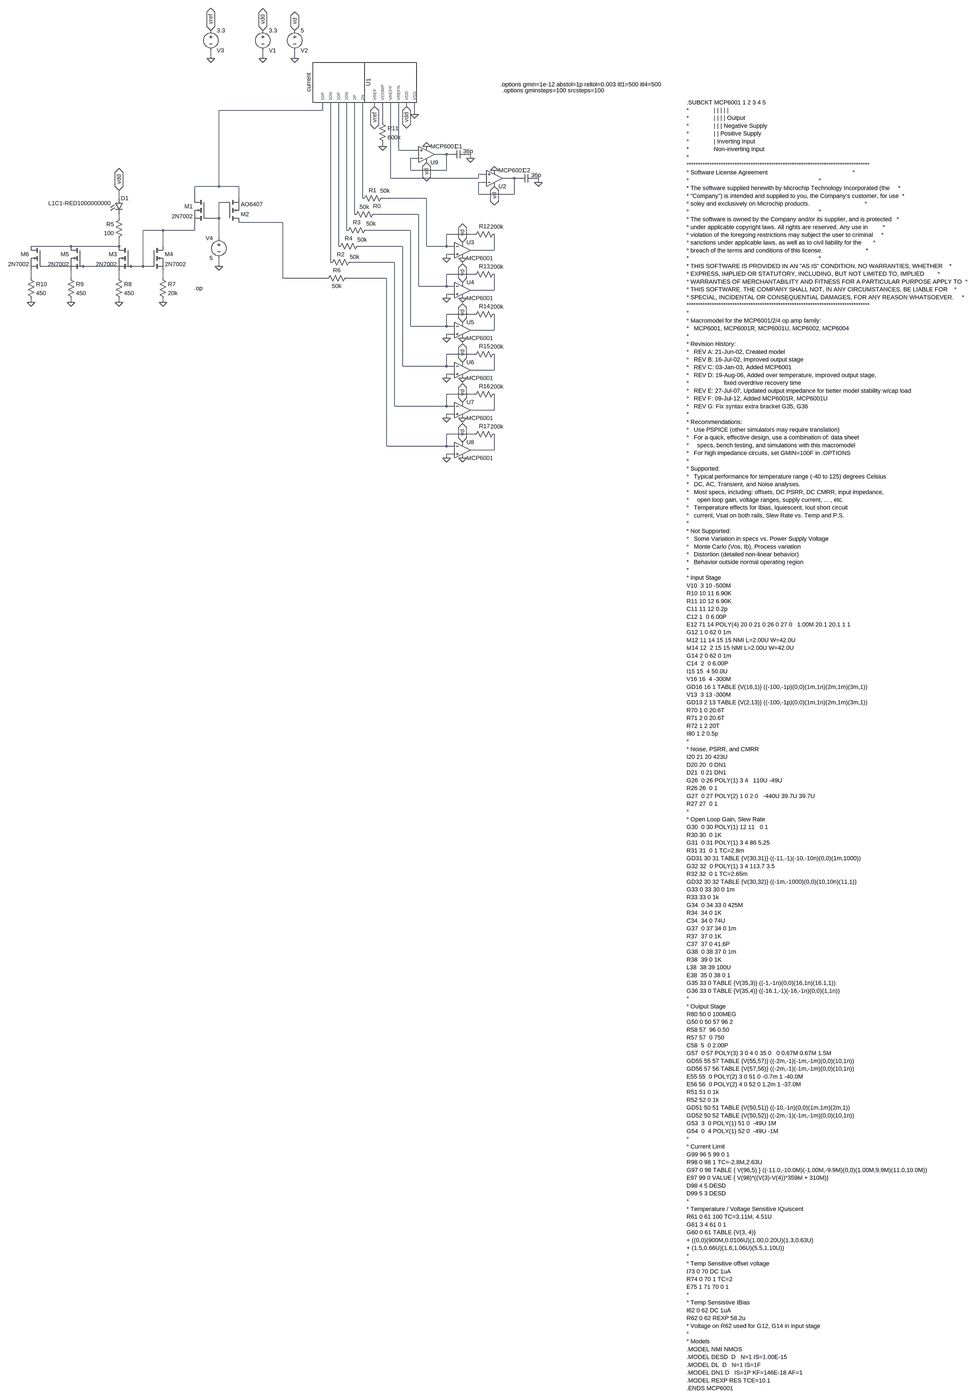
[diagram p0: schematic Chipa_schem_mcp6001.asc, whole sheet]
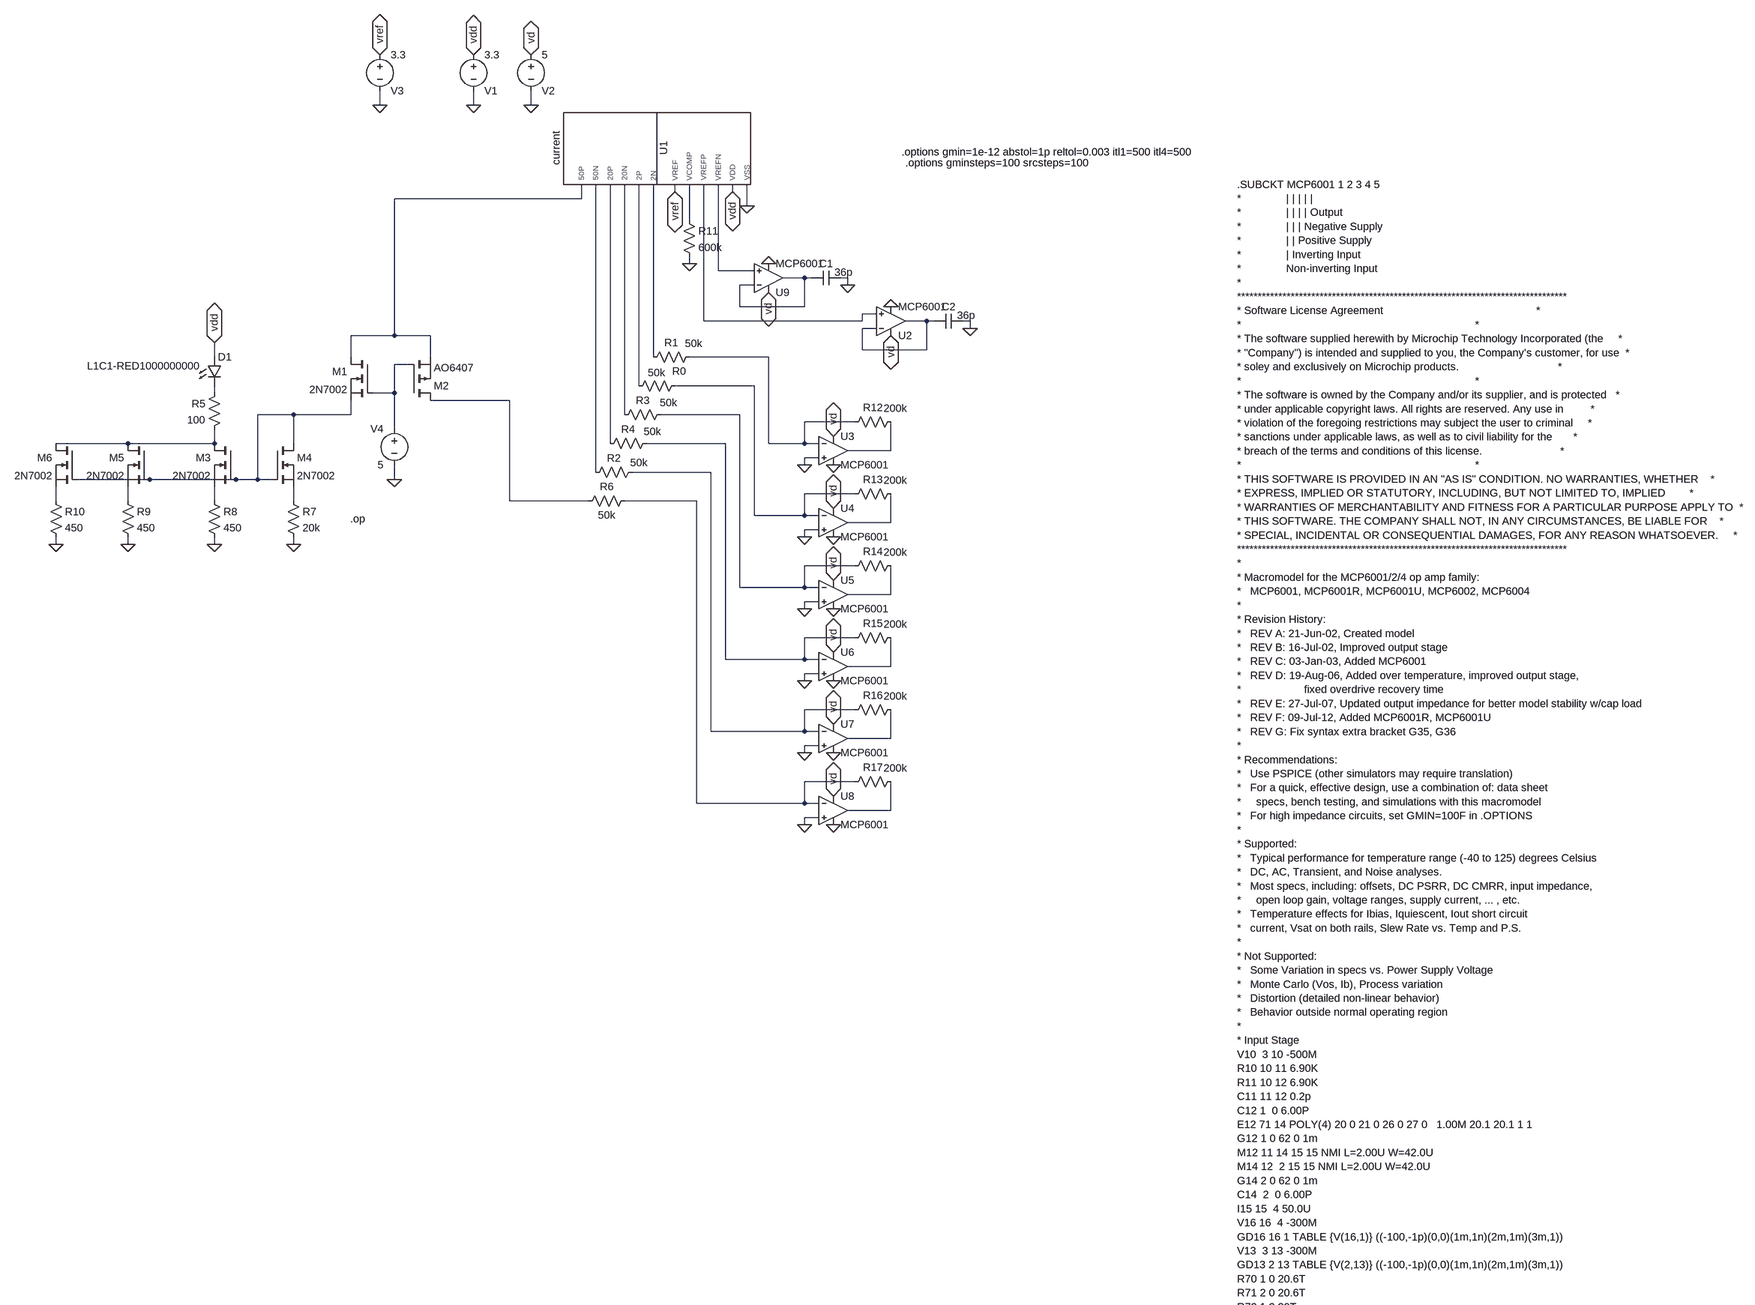
[diagram p1: schematic Chipa_schem_mcp6001.asc, part, row 1 of 2, column 1 of 1]
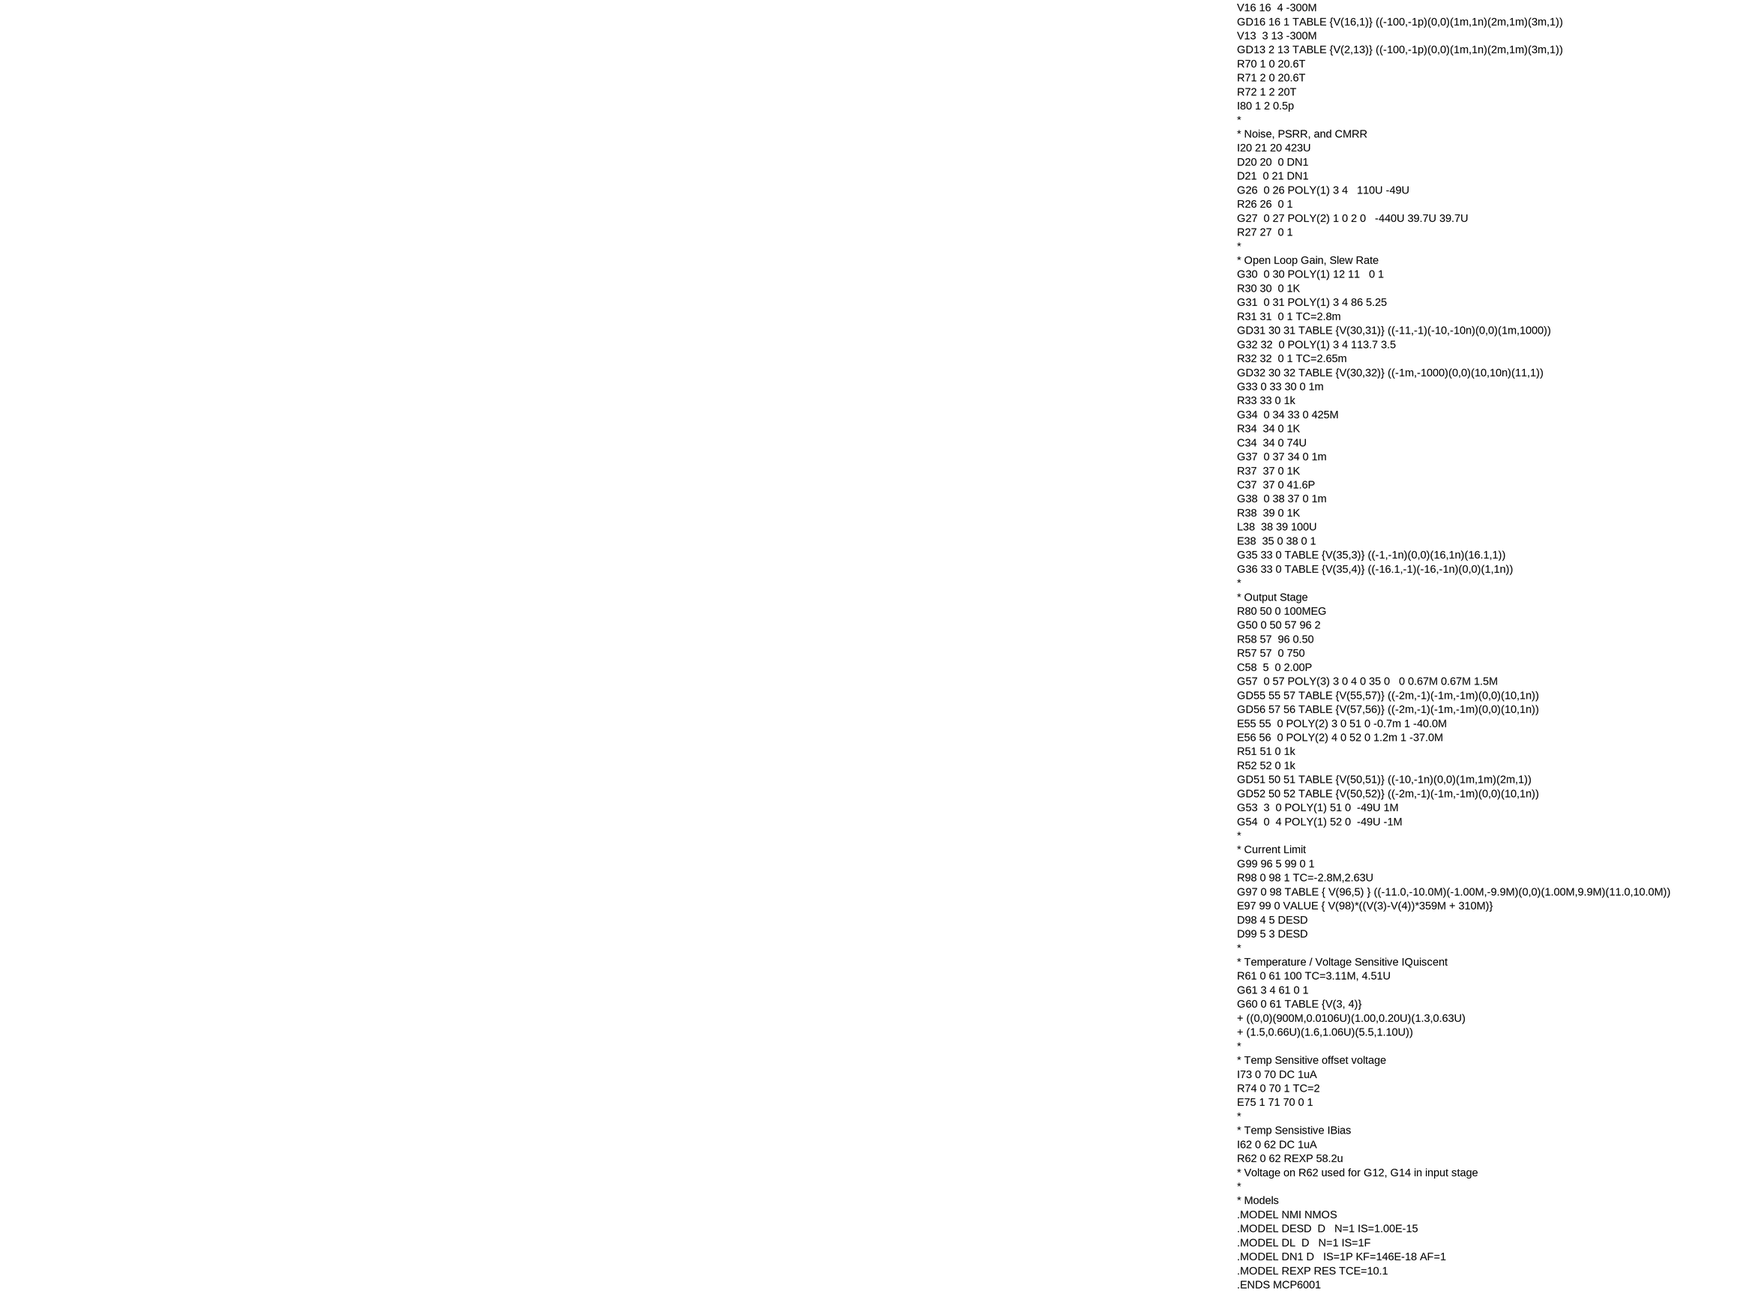
[diagram p2: schematic Chipa_schem_mcp6001.asc, part, row 2 of 2, column 1 of 1]
Chipa_schem_mcp6001.asc, the LTspice schematic file:
Version 4
SHEET 1 2840 4876
WIRE -320 64 -320 32
WIRE -112 64 -112 32
WIRE 16 64 16 32
WIRE 336 256 336 240
WIRE 464 256 464 240
WIRE 128 272 128 240
WIRE 128 272 -288 272
WIRE 496 288 496 240
WIRE 368 320 368 240
WIRE 368 416 368 400
WIRE 432 432 432 240
WIRE 512 432 432 432
WIRE 624 448 576 448
WIRE 640 448 624 448
WIRE 720 448 704 448
WIRE 512 464 480 464
WIRE 720 464 720 448
WIRE 480 512 480 464
WIRE 624 512 624 448
WIRE 624 512 480 512
WIRE 784 528 752 528
WIRE 400 544 400 240
WIRE 752 544 752 528
WIRE 752 544 400 544
WIRE 896 544 848 544
WIRE 912 544 896 544
WIRE 992 544 976 544
WIRE 784 560 752 560
WIRE 992 560 992 544
WIRE -288 576 -288 272
WIRE -288 576 -384 576
WIRE -208 576 -288 576
WIRE 752 608 752 560
WIRE 896 608 896 544
WIRE 896 608 752 608
WIRE -688 624 -688 592
WIRE -384 624 -384 576
WIRE -208 624 -208 576
WIRE 288 624 288 240
WIRE 544 624 368 624
WIRE -256 640 -288 640
WIRE 256 688 256 240
WIRE 512 688 336 688
WIRE -688 704 -688 688
WIRE -288 704 -288 640
WIRE -288 704 -336 704
WIRE -32 720 -208 720
WIRE -512 752 -592 752
WIRE -384 752 -384 720
WIRE -384 752 -512 752
WIRE 224 752 224 240
WIRE 480 752 304 752
WIRE 736 768 624 768
WIRE -288 784 -288 704
WIRE -880 816 -1040 816
WIRE -688 816 -688 784
WIRE -688 816 -880 816
WIRE -512 816 -512 752
WIRE 192 816 192 240
WIRE 448 816 272 816
WIRE 544 816 544 624
WIRE 624 816 624 768
WIRE 624 816 544 816
WIRE 656 816 624 816
WIRE 816 832 816 768
WIRE 816 832 720 832
WIRE 656 848 624 848
WIRE 624 864 624 848
WIRE 160 880 160 240
WIRE 416 880 240 880
WIRE -832 896 -992 896
WIRE -640 896 -832 896
WIRE -592 896 -592 752
WIRE -592 896 -640 896
WIRE -560 896 -592 896
WIRE -288 896 -288 864
WIRE 736 928 624 928
WIRE -1040 944 -1040 912
WIRE -880 944 -880 912
WIRE -688 944 -688 912
WIRE -512 944 -512 912
WIRE -32 944 -32 720
WIRE 144 944 -32 944
WIRE 384 944 224 944
WIRE 512 976 512 688
WIRE 624 976 624 928
WIRE 624 976 512 976
WIRE 656 976 624 976
WIRE 816 992 816 928
WIRE 816 992 720 992
WIRE 656 1008 624 1008
WIRE 624 1024 624 1008
WIRE -1040 1040 -1040 1024
WIRE -880 1040 -880 1024
WIRE -688 1040 -688 1024
WIRE -512 1040 -512 1024
WIRE 736 1088 624 1088
WIRE 480 1136 480 752
WIRE 624 1136 624 1088
WIRE 624 1136 480 1136
WIRE 656 1136 624 1136
WIRE 816 1152 816 1088
WIRE 816 1152 720 1152
WIRE 656 1168 624 1168
WIRE 624 1184 624 1168
WIRE 736 1248 624 1248
WIRE 448 1296 448 816
WIRE 624 1296 624 1248
WIRE 624 1296 448 1296
WIRE 656 1296 624 1296
WIRE 816 1312 816 1248
WIRE 816 1312 720 1312
WIRE 656 1328 624 1328
WIRE 624 1344 624 1328
WIRE 736 1408 624 1408
WIRE 416 1456 416 880
WIRE 624 1456 624 1408
WIRE 624 1456 416 1456
WIRE 656 1456 624 1456
WIRE 816 1472 816 1408
WIRE 816 1472 720 1472
WIRE 656 1488 624 1488
WIRE 624 1504 624 1488
WIRE 736 1568 624 1568
WIRE 384 1616 384 944
WIRE 624 1616 624 1568
WIRE 624 1616 384 1616
WIRE 656 1616 624 1616
WIRE 816 1632 816 1568
WIRE 816 1632 720 1632
WIRE 656 1648 624 1648
WIRE 624 1664 624 1648
FLAG -112 64 0
FLAG -320 64 0
FLAG -112 -48 vdd
IOPIN -112 -48 BiDir
FLAG -320 -48 vref
IOPIN -320 -48 BiDir
FLAG -288 896 0
FLAG -688 592 vdd
IOPIN -688 592 BiDir
FLAG 496 288 0
FLAG 464 256 vdd
IOPIN 464 256 BiDir
FLAG 336 256 vref
IOPIN 336 256 BiDir
FLAG -512 1040 0
FLAG -688 1040 0
FLAG 544 480 vd
IOPIN 544 480 BiDir
FLAG 720 464 0
FLAG 816 576 vd
IOPIN 816 576 BiDir
FLAG 992 560 0
FLAG -880 1040 0
FLAG -1040 1040 0
FLAG 368 416 0
FLAG 688 800 vd
IOPIN 688 800 BiDir
FLAG 624 864 0
FLAG 16 64 0
FLAG 16 -48 vd
IOPIN 16 -48 BiDir
FLAG 688 864 0
FLAG 544 416 0
FLAG 816 512 0
FLAG 688 960 vd
IOPIN 688 960 BiDir
FLAG 624 1024 0
FLAG 688 1024 0
FLAG 688 1120 vd
IOPIN 688 1120 BiDir
FLAG 624 1184 0
FLAG 688 1184 0
FLAG 688 1280 vd
IOPIN 688 1280 BiDir
FLAG 624 1344 0
FLAG 688 1344 0
FLAG 688 1440 vd
IOPIN 688 1440 BiDir
FLAG 624 1504 0
FLAG 688 1504 0
FLAG 688 1600 vd
IOPIN 688 1600 BiDir
FLAG 624 1664 0
FLAG 688 1664 0
DATAFLAG -320 576 ""
DATAFLAG -880 736 "I(R5)"
DATAFLAG -480 752 ""
DATAFLAG 48 992 "I(R6)"
DATAFLAG 352 944 "I(R2)"
DATAFLAG 384 880 "I(R4)"
DATAFLAG 384 800 "I(R3)"
DATAFLAG 432 672 "I(R0)"
DATAFLAG 432 608 "I(R1)"
DATAFLAG 624 448 ""
DATAFLAG 896 544 ""
DATAFLAG 464 432 ""
DATAFLAG 464 528 ""
DATAFLAG 576 624 ""
DATAFLAG 608 768 ""
DATAFLAG 816 832 ""
DATAFLAG 288 576 ""
DATAFLAG 256 672 ""
DATAFLAG 224 736 ""
DATAFLAG 192 688 ""
DATAFLAG 160 832 ""
DATAFLAG 608 928 ""
DATAFLAG 816 992 ""
DATAFLAG 608 1088 ""
DATAFLAG 816 1152 ""
DATAFLAG 608 1248 ""
DATAFLAG 816 1312 ""
DATAFLAG 608 1408 ""
DATAFLAG 816 1472 ""
DATAFLAG 608 1568 ""
DATAFLAG 816 1632 ""
SYMBOL current 176 160 R0
WINDOW 0 120 0 VTop 2
SYMATTR InstName U1
SYMBOL res 384 608 R90
WINDOW 0 0 56 VBottom 2
WINDOW 3 -30 6 VTop 2
SYMATTR InstName R1
SYMATTR Value 50k
SYMBOL res 352 672 R90
WINDOW 0 -1 7 VBottom 2
WINDOW 3 -29 57 VTop 2
SYMATTR InstName R0
SYMATTR Value 50k
SYMBOL res 320 736 R90
WINDOW 0 0 56 VBottom 2
WINDOW 3 -26 -2 VTop 2
SYMATTR InstName R3
SYMATTR Value 50k
SYMBOL res 288 800 R90
WINDOW 0 0 56 VBottom 2
WINDOW 3 -26 2 VTop 2
SYMATTR InstName R4
SYMATTR Value 50k
SYMBOL res 144 896 R270
WINDOW 0 32 56 VTop 2
WINDOW 3 53 112 VBottom 2
SYMATTR InstName R2
SYMATTR Value 50k
SYMBOL voltage -112 -64 R0
WINDOW 0 24 96 Left 2
WINDOW 3 24 16 Left 2
WINDOW 123 0 0 Left 0
WINDOW 39 0 0 Left 0
SYMATTR InstName V1
SYMATTR Value 3.3
SYMBOL voltage -320 -64 R0
WINDOW 0 24 96 Left 2
WINDOW 3 24 16 Left 2
WINDOW 123 0 0 Left 0
WINDOW 39 0 0 Left 0
SYMATTR InstName V3
SYMATTR Value 3.3
SYMBOL nmos -336 624 M0
SYMATTR InstName M1
SYMATTR Value 2N7002
SYMBOL pmos -256 720 M180
SYMATTR InstName M2
SYMATTR Value AO6407
SYMBOL voltage -288 768 M0
WINDOW 123 0 0 Left 0
WINDOW 39 0 0 Left 0
SYMATTR InstName V4
SYMATTR Value 5
SYMBOL nmos -640 816 M0
SYMATTR InstName M3
SYMATTR Value 2N7002
SYMBOL nmos -560 816 R0
SYMATTR InstName M4
SYMATTR Value 2N7002
SYMBOL res -672 688 M0
SYMATTR InstName R5
SYMATTR Value 100
SYMBOL res 240 928 R90
WINDOW 0 0 56 VBottom 2
WINDOW 3 32 56 VTop 2
SYMATTR InstName R6
SYMATTR Value 50k
SYMBOL res -528 928 R0
SYMATTR InstName R7
SYMATTR Value 20k
SYMBOL res -704 928 R0
SYMATTR InstName R8
SYMATTR Value 450
SYMBOL LED -704 624 R0
WINDOW 3 -267 20 Left 2
SYMATTR Value L1C1-RED1000000000
SYMATTR InstName D1
SYMATTR Description Diode
SYMATTR Type diode
SYMBOL cap 704 432 R90
WINDOW 0 0 32 VBottom 2
WINDOW 3 -12 -7 VTop 2
SYMATTR InstName C1
SYMATTR Value 36p
SYMBOL cap 976 528 R90
WINDOW 0 0 32 VBottom 2
WINDOW 3 -12 -7 VTop 2
SYMATTR InstName C2
SYMATTR Value 36p
SYMBOL nmos -832 816 M0
SYMATTR InstName M5
SYMATTR Value 2N7002
SYMBOL res -896 928 R0
SYMATTR InstName R9
SYMATTR Value 450
SYMBOL nmos -992 816 M0
SYMATTR InstName M6
SYMATTR Value 2N7002
SYMBOL res -1056 928 R0
SYMATTR InstName R10
SYMATTR Value 450
SYMBOL res 352 304 R0
SYMATTR InstName R11
SYMATTR Value 600k
SYMBOL res 832 752 R90
WINDOW 0 0 56 VBottom 2
WINDOW 3 -30 6 VTop 2
SYMATTR InstName R12
SYMATTR Value 200k
SYMBOL voltage 16 -64 R0
WINDOW 0 24 96 Left 2
WINDOW 3 24 16 Left 2
WINDOW 123 0 0 Left 0
WINDOW 39 0 0 Left 0
SYMATTR InstName V2
SYMATTR Value 5
SYMBOL res 832 912 R90
WINDOW 0 0 56 VBottom 2
WINDOW 3 -30 6 VTop 2
SYMATTR InstName R13
SYMATTR Value 200k
SYMBOL res 832 1072 R90
WINDOW 0 0 56 VBottom 2
WINDOW 3 -30 6 VTop 2
SYMATTR InstName R14
SYMATTR Value 200k
SYMBOL res 832 1232 R90
WINDOW 0 0 56 VBottom 2
WINDOW 3 -30 6 VTop 2
SYMATTR InstName R15
SYMATTR Value 200k
SYMBOL res 832 1392 R90
WINDOW 0 0 56 VBottom 2
WINDOW 3 -30 6 VTop 2
SYMATTR InstName R16
SYMATTR Value 200k
SYMBOL res 832 1552 R90
WINDOW 0 0 56 VBottom 2
WINDOW 3 -30 6 VTop 2
SYMATTR InstName R17
SYMATTR Value 200k
SYMBOL OpAmps\\opamp2 544 512 M180
SYMATTR InstName U9
SYMATTR Value MCP6001
SYMBOL OpAmps\\opamp2 816 608 M180
SYMATTR InstName U2
SYMATTR Value MCP6001
SYMBOL OpAmps\\opamp2 688 768 R0
SYMATTR InstName U3
SYMATTR Value MCP6001
SYMBOL OpAmps\\opamp2 688 928 R0
SYMATTR InstName U4
SYMATTR Value MCP6001
SYMBOL OpAmps\\opamp2 688 1088 R0
SYMATTR InstName U5
SYMATTR Value MCP6001
SYMBOL OpAmps\\opamp2 688 1248 R0
SYMATTR InstName U6
SYMATTR Value MCP6001
SYMBOL OpAmps\\opamp2 688 1408 R0
SYMATTR InstName U7
SYMATTR Value MCP6001
SYMBOL OpAmps\\opamp2 688 1568 R0
SYMATTR InstName U8
SYMATTR Value MCP6001
TEXT -352 984 Right 2 !.op
TEXT 1664 240 Left 2 !.SUBCKT MCP6001 1 2 3 4 5\n*               | | | | |\n*               | | | | Output\n*               | | | Negative Supply\n*               | | Positive Supply\n*               | Inverting Input\n*               Non-inverting Input\n*\n********************************************************************************\n* Software License Agreement                                                   *\n*                                                                              *\n* The software supplied herewith by Microchip Technology Incorporated (the     *\n* "Company") is intended and supplied to you, the Company's customer, for use  *\n* soley and exclusively on Microchip products.                                 *\n*                                                                              *\n* The software is owned by the Company and/or its supplier, and is protected   *\n* under applicable copyright laws. All rights are reserved. Any use in         *\n* violation of the foregoing restrictions may subject the user to criminal     *\n* sanctions under applicable laws, as well as to civil liability for the       *\n* breach of the terms and conditions of this license.                          *\n*                                                                              *\n* THIS SOFTWARE IS PROVIDED IN AN "AS IS" CONDITION. NO WARRANTIES, WHETHER    *\n* EXPRESS, IMPLIED OR STATUTORY, INCLUDING, BUT NOT LIMITED TO, IMPLIED        *\n* WARRANTIES OF MERCHANTABILITY AND FITNESS FOR A PARTICULAR PURPOSE APPLY TO  *\n* THIS SOFTWARE. THE COMPANY SHALL NOT, IN ANY CIRCUMSTANCES, BE LIABLE FOR    *\n* SPECIAL, INCIDENTAL OR CONSEQUENTIAL DAMAGES, FOR ANY REASON WHATSOEVER.     *\n********************************************************************************\n*\n* Macromodel for the MCP6001/2/4 op amp family:\n*   MCP6001, MCP6001R, MCP6001U, MCP6002, MCP6004\n*\n* Revision History:\n*   REV A: 21-Jun-02, Created model\n*   REV B: 16-Jul-02, Improved output stage\n*   REV C: 03-Jan-03, Added MCP6001\n*   REV D: 19-Aug-06, Added over temperature, improved output stage, \n*                     fixed overdrive recovery time\n*   REV E: 27-Jul-07, Updated output impedance for better model stability w/cap load\n*   REV F: 09-Jul-12, Added MCP6001R, MCP6001U\n*   REV G: Fix syntax extra bracket G35, G36\n*\n* Recommendations:\n*   Use PSPICE (other simulators may require translation)\n*   For a quick, effective design, use a combination of: data sheet\n*     specs, bench testing, and simulations with this macromodel\n*   For high impedance circuits, set GMIN=100F in .OPTIONS\n*\n* Supported:\n*   Typical performance for temperature range (-40 to 125) degrees Celsius\n*   DC, AC, Transient, and Noise analyses.\n*   Most specs, including: offsets, DC PSRR, DC CMRR, input impedance,\n*     open loop gain, voltage ranges, supply current, ... , etc.\n*   Temperature effects for Ibias, Iquiescent, Iout short circuit \n*   current, Vsat on both rails, Slew Rate vs. Temp and P.S.\n*\n* Not Supported:\n*   Some Variation in specs vs. Power Supply Voltage\n*   Monte Carlo (Vos, Ib), Process variation\n*   Distortion (detailed non-linear behavior)\n*   Behavior outside normal operating region\n*\n* Input Stage\nV10  3 10 -500M\nR10 10 11 6.90K \nR11 10 12 6.90K \nC11 11 12 0.2p\nC12 1  0 6.00P \nE12 71 14 POLY(4) 20 0 21 0 26 0 27 0   1.00M 20.1 20.1 1 1\nG12 1 0 62 0 1m \nM12 11 14 15 15 NMI L=2.00U W=42.0U\nM14 12  2 15 15 NMI L=2.00U W=42.0U\nG14 2 0 62 0 1m \nC14  2  0 6.00P \nI15 15  4 50.0U\nV16 16  4 -300M\nGD16 16 1 TABLE {V(16,1)} ((-100,-1p)(0,0)(1m,1n)(2m,1m)(3m,1)) \nV13  3 13 -300M\nGD13 2 13 TABLE {V(2,13)} ((-100,-1p)(0,0)(1m,1n)(2m,1m)(3m,1)) \nR70 1 0 20.6T  \nR71 2 0 20.6T \nR72 1 2 20T \nI80 1 2 0.5p\n*\n* Noise, PSRR, and CMRR\nI20 21 20 423U\nD20 20  0 DN1\nD21  0 21 DN1\nG26  0 26 POLY(1) 3 4   110U -49U\nR26 26  0 1\nG27  0 27 POLY(2) 1 0 2 0   -440U 39.7U 39.7U\nR27 27  0 1\n*\n* Open Loop Gain, Slew Rate\nG30  0 30 POLY(1) 12 11   0 1\nR30 30  0 1K\nG31  0 31 POLY(1) 3 4 86 5.25\nR31 31  0 1 TC=2.8m\nGD31 30 31 TABLE {V(30,31)} ((-11,-1)(-10,-10n)(0,0)(1m,1000))\nG32 32  0 POLY(1) 3 4 113.7 3.5\nR32 32  0 1 TC=2.65m\nGD32 30 32 TABLE {V(30,32)} ((-1m,-1000)(0,0)(10,10n)(11,1))\nG33 0 33 30 0 1m\nR33 33 0 1k\nG34  0 34 33 0 425M\nR34  34 0 1K\nC34  34 0 74U\nG37  0 37 34 0 1m\nR37  37 0 1K\nC37  37 0 41.6P \nG38  0 38 37 0 1m\nR38  39 0 1K\nL38  38 39 100U\nE38  35 0 38 0 1\nG35 33 0 TABLE {V(35,3)} ((-1,-1n)(0,0)(16,1n)(16.1,1))\nG36 33 0 TABLE {V(35,4)} ((-16.1,-1)(-16,-1n)(0,0)(1,1n))\n*\n* Output Stage \nR80 50 0 100MEG\nG50 0 50 57 96 2\nR58 57  96 0.50\nR57 57  0 750\nC58  5  0 2.00P\nG57  0 57 POLY(3) 3 0 4 0 35 0   0 0.67M 0.67M 1.5M\nGD55 55 57 TABLE {V(55,57)} ((-2m,-1)(-1m,-1m)(0,0)(10,1n))\nGD56 57 56 TABLE {V(57,56)} ((-2m,-1)(-1m,-1m)(0,0)(10,1n))\nE55 55  0 POLY(2) 3 0 51 0 -0.7m 1 -40.0M\nE56 56  0 POLY(2) 4 0 52 0 1.2m 1 -37.0M\nR51 51 0 1k\nR52 52 0 1k\nGD51 50 51 TABLE {V(50,51)} ((-10,-1n)(0,0)(1m,1m)(2m,1))\nGD52 50 52 TABLE {V(50,52)} ((-2m,-1)(-1m,-1m)(0,0)(10,1n)) \nG53  3  0 POLY(1) 51 0  -49U 1M\nG54  0  4 POLY(1) 52 0  -49U -1M\n*\n* Current Limit \nG99 96 5 99 0 1 \nR98 0 98 1 TC=-2.8M,2.63U \nG97 0 98 TABLE { V(96,5) } ((-11.0,-10.0M)(-1.00M,-9.9M)(0,0)(1.00M,9.9M)(11.0,10.0M)) \nE97 99 0 VALUE { V(98)*((V(3)-V(4))*359M + 310M)} \nD98 4 5 DESD \nD99 5 3 DESD \n*\n* Temperature / Voltage Sensitive IQuiscent\nR61 0 61 100 TC=3.11M, 4.51U\nG61 3 4 61 0 1\nG60 0 61 TABLE {V(3, 4)} \n+ ((0,0)(900M,0.0106U)(1.00,0.20U)(1.3,0.63U)\n+ (1.5,0.66U)(1.6,1.06U)(5.5,1.10U))\n*\n* Temp Sensitive offset voltage \nI73 0 70 DC 1uA \nR74 0 70 1 TC=2 \nE75 1 71 70 0 1 \n*\n* Temp Sensistive IBias \nI62 0 62 DC 1uA \nR62 0 62 REXP 58.2u \n* Voltage on R62 used for G12, G14 in input stage\n*\n* Models\n.MODEL NMI NMOS\n.MODEL DESD  D   N=1 IS=1.00E-15 \n.MODEL DL  D   N=1 IS=1F \n.MODEL DN1 D   IS=1P KF=146E-18 AF=1\n.MODEL REXP RES TCE=10.1 \n.ENDS MCP6001
TEXT 840 168 Left 2 !.options gmin=1e-12 abstol=1p reltol=0.003 itl1=500 itl4=500
TEXT 848 192 Left 2 !.options gminsteps=100 srcsteps=100

The netlist it stands for:
* Chipa_schem_mcp6001.asc
XU1 vref N002 N003 N005 vdd N015 N018 N021 N001 N007 N010 0 current  ; pins VREF VCOMP VREFN VREFP VDD 20N 20P 50N 50P 2N 2P VSS
R1 N008 N007 50k
R0 N011 N010 50k
R3 N016 N015 50k
R4 N019 N018 50k
R2 N021 N022 50k
V1 vdd 0 3.3
V3 vref 0 3.3
M1 N001 N009 N014 N014 2N7002
M2 N013 N009 N001 N001 AO6407
V4 N009 0 5
M3 N017 N014 N025 N025 2N7002
M4 N014 N014 N026 N026 2N7002
R5 N012 N017 100
R6 N027 N013 50k
R7 N026 0 20k
R8 N025 0 450
D1 vdd N012 L1C1-RED1000000000
C1 0 N004 36p
C2 0 N006 36p
M5 N017 N014 N024 N024 2N7002
R9 N024 0 450
M6 N017 N014 N023 N023 2N7002
R10 N023 0 450
R11 N002 0 600k
R12 N020 N008 200k
V2 vd 0 5
R13 N028 N011 200k
R14 N029 N016 200k
R15 N030 N019 200k
R16 N031 N022 200k
R17 N032 N027 200k
XU9 N003 N004 vd 0 N004 MCP6001  ; pins In+ In- V+ V- OUT
XU2 N005 N006 vd 0 N006 MCP6001  ; pins In+ In- V+ V- OUT
XU3 0 N008 vd 0 N020 MCP6001  ; pins In+ In- V+ V- OUT
XU4 0 N011 vd 0 N028 MCP6001  ; pins In+ In- V+ V- OUT
XU5 0 N016 vd 0 N029 MCP6001  ; pins In+ In- V+ V- OUT
XU6 0 N019 vd 0 N030 MCP6001  ; pins In+ In- V+ V- OUT
XU7 0 N022 vd 0 N031 MCP6001  ; pins In+ In- V+ V- OUT
XU8 0 N027 vd 0 N032 MCP6001  ; pins In+ In- V+ V- OUT
.model D D
.lib standard.dio
.model NMOS NMOS
.model PMOS PMOS
.lib standard.mos
.op
.SUBCKT MCP6001 1 2 3 4 5
*               | | | | |
*               | | | | Output
*               | | | Negative Supply
*               | | Positive Supply
*               | Inverting Input
*               Non-inverting Input
*
********************************************************************************
* Software License Agreement                                                   *
*                                                                              *
* The software supplied herewith by Microchip Technology Incorporated (the     *
* "Company") is intended and supplied to you, the Company's customer, for use  *
* soley and exclusively on Microchip products.                                 *
*                                                                              *
* The software is owned by the Company and/or its supplier, and is protected   *
* under applicable copyright laws. All rights are reserved. Any use in         *
* violation of the foregoing restrictions may subject the user to criminal     *
* sanctions under applicable laws, as well as to civil liability for the       *
* breach of the terms and conditions of this license.                          *
*                                                                              *
* THIS SOFTWARE IS PROVIDED IN AN "AS IS" CONDITION. NO WARRANTIES, WHETHER    *
* EXPRESS, IMPLIED OR STATUTORY, INCLUDING, BUT NOT LIMITED TO, IMPLIED        *
* WARRANTIES OF MERCHANTABILITY AND FITNESS FOR A PARTICULAR PURPOSE APPLY TO  *
* THIS SOFTWARE. THE COMPANY SHALL NOT, IN ANY CIRCUMSTANCES, BE LIABLE FOR    *
* SPECIAL, INCIDENTAL OR CONSEQUENTIAL DAMAGES, FOR ANY REASON WHATSOEVER.     *
********************************************************************************
*
* Macromodel for the MCP6001/2/4 op amp family:
*   MCP6001, MCP6001R, MCP6001U, MCP6002, MCP6004
*
* Revision History:
*   REV A: 21-Jun-02, Created model
*   REV B: 16-Jul-02, Improved output stage
*   REV C: 03-Jan-03, Added MCP6001
*   REV D: 19-Aug-06, Added over temperature, improved output stage,
*                     fixed overdrive recovery time
*   REV E: 27-Jul-07, Updated output impedance for better model stability w/cap load
*   REV F: 09-Jul-12, Added MCP6001R, MCP6001U
*   REV G: Fix syntax extra bracket G35, G36
*
* Recommendations:
*   Use PSPICE (other simulators may require translation)
*   For a quick, effective design, use a combination of: data sheet
*     specs, bench testing, and simulations with this macromodel
*   For high impedance circuits, set GMIN=100F in .OPTIONS
*
* Supported:
*   Typical performance for temperature range (-40 to 125) degrees Celsius
*   DC, AC, Transient, and Noise analyses.
*   Most specs, including: offsets, DC PSRR, DC CMRR, input impedance,
*     open loop gain, voltage ranges, supply current, ... , etc.
*   Temperature effects for Ibias, Iquiescent, Iout short circuit
*   current, Vsat on both rails, Slew Rate vs. Temp and P.S.
*
* Not Supported:
*   Some Variation in specs vs. Power Supply Voltage
*   Monte Carlo (Vos, Ib), Process variation
*   Distortion (detailed non-linear behavior)
*   Behavior outside normal operating region
*
* Input Stage
V10  3 10 -500M
R10 10 11 6.90K
R11 10 12 6.90K
C11 11 12 0.2p
C12 1  0 6.00P
E12 71 14 POLY(4) 20 0 21 0 26 0 27 0   1.00M 20.1 20.1 1 1
G12 1 0 62 0 1m
M12 11 14 15 15 NMI L=2.00U W=42.0U
M14 12  2 15 15 NMI L=2.00U W=42.0U
G14 2 0 62 0 1m
C14  2  0 6.00P
I15 15  4 50.0U
V16 16  4 -300M
GD16 16 1 TABLE {V(16,1)} ((-100,-1p)(0,0)(1m,1n)(2m,1m)(3m,1))
V13  3 13 -300M
GD13 2 13 TABLE {V(2,13)} ((-100,-1p)(0,0)(1m,1n)(2m,1m)(3m,1))
R70 1 0 20.6T
R71 2 0 20.6T
R72 1 2 20T
I80 1 2 0.5p
*
* Noise, PSRR, and CMRR
I20 21 20 423U
D20 20  0 DN1
D21  0 21 DN1
G26  0 26 POLY(1) 3 4   110U -49U
R26 26  0 1
G27  0 27 POLY(2) 1 0 2 0   -440U 39.7U 39.7U
R27 27  0 1
*
* Open Loop Gain, Slew Rate
G30  0 30 POLY(1) 12 11   0 1
R30 30  0 1K
G31  0 31 POLY(1) 3 4 86 5.25
R31 31  0 1 TC=2.8m
GD31 30 31 TABLE {V(30,31)} ((-11,-1)(-10,-10n)(0,0)(1m,1000))
G32 32  0 POLY(1) 3 4 113.7 3.5
R32 32  0 1 TC=2.65m
GD32 30 32 TABLE {V(30,32)} ((-1m,-1000)(0,0)(10,10n)(11,1))
G33 0 33 30 0 1m
R33 33 0 1k
G34  0 34 33 0 425M
R34  34 0 1K
C34  34 0 74U
G37  0 37 34 0 1m
R37  37 0 1K
C37  37 0 41.6P
G38  0 38 37 0 1m
R38  39 0 1K
L38  38 39 100U
E38  35 0 38 0 1
G35 33 0 TABLE {V(35,3)} ((-1,-1n)(0,0)(16,1n)(16.1,1))
G36 33 0 TABLE {V(35,4)} ((-16.1,-1)(-16,-1n)(0,0)(1,1n))
*
* Output Stage
R80 50 0 100MEG
G50 0 50 57 96 2
R58 57  96 0.50
R57 57  0 750
C58  5  0 2.00P
G57  0 57 POLY(3) 3 0 4 0 35 0   0 0.67M 0.67M 1.5M
GD55 55 57 TABLE {V(55,57)} ((-2m,-1)(-1m,-1m)(0,0)(10,1n))
GD56 57 56 TABLE {V(57,56)} ((-2m,-1)(-1m,-1m)(0,0)(10,1n))
E55 55  0 POLY(2) 3 0 51 0 -0.7m 1 -40.0M
E56 56  0 POLY(2) 4 0 52 0 1.2m 1 -37.0M
R51 51 0 1k
R52 52 0 1k
GD51 50 51 TABLE {V(50,51)} ((-10,-1n)(0,0)(1m,1m)(2m,1))
GD52 50 52 TABLE {V(50,52)} ((-2m,-1)(-1m,-1m)(0,0)(10,1n))
G53  3  0 POLY(1) 51 0  -49U 1M
G54  0  4 POLY(1) 52 0  -49U -1M
*
* Current Limit
G99 96 5 99 0 1
R98 0 98 1 TC=-2.8M,2.63U
G97 0 98 TABLE { V(96,5) } ((-11.0,-10.0M)(-1.00M,-9.9M)(0,0)(1.00M,9.9M)(11.0,10.0M))
E97 99 0 VALUE { V(98)*((V(3)-V(4))*359M + 310M)}
D98 4 5 DESD
D99 5 3 DESD
*
* Temperature / Voltage Sensitive IQuiscent
R61 0 61 100 TC=3.11M, 4.51U
G61 3 4 61 0 1
G60 0 61 TABLE {V(3, 4)}
+ ((0,0)(900M,0.0106U)(1.00,0.20U)(1.3,0.63U)
+ (1.5,0.66U)(1.6,1.06U)(5.5,1.10U))
*
* Temp Sensitive offset voltage
I73 0 70 DC 1uA
R74 0 70 1 TC=2
E75 1 71 70 0 1
*
* Temp Sensistive IBias
I62 0 62 DC 1uA
R62 0 62 REXP 58.2u
* Voltage on R62 used for G12, G14 in input stage
*
* Models
.MODEL NMI NMOS
.MODEL DESD  D   N=1 IS=1.00E-15
.MODEL DL  D   N=1 IS=1F
.MODEL DN1 D   IS=1P KF=146E-18 AF=1
.MODEL REXP RES TCE=10.1
.ENDS MCP6001
.options gmin=1e-12 abstol=1p reltol=0.003 itl1=500 itl4=500
.options gminsteps=100 srcsteps=100
.lib C:\Users\escor\OneDrive\Escritorio\Alex onchip\current.txt
.backanno
.end